# Altium schematic sheet Sheet1.SchDoc
size 410 x 297 mm; SheetNumber: 2; SheetTotal: 2
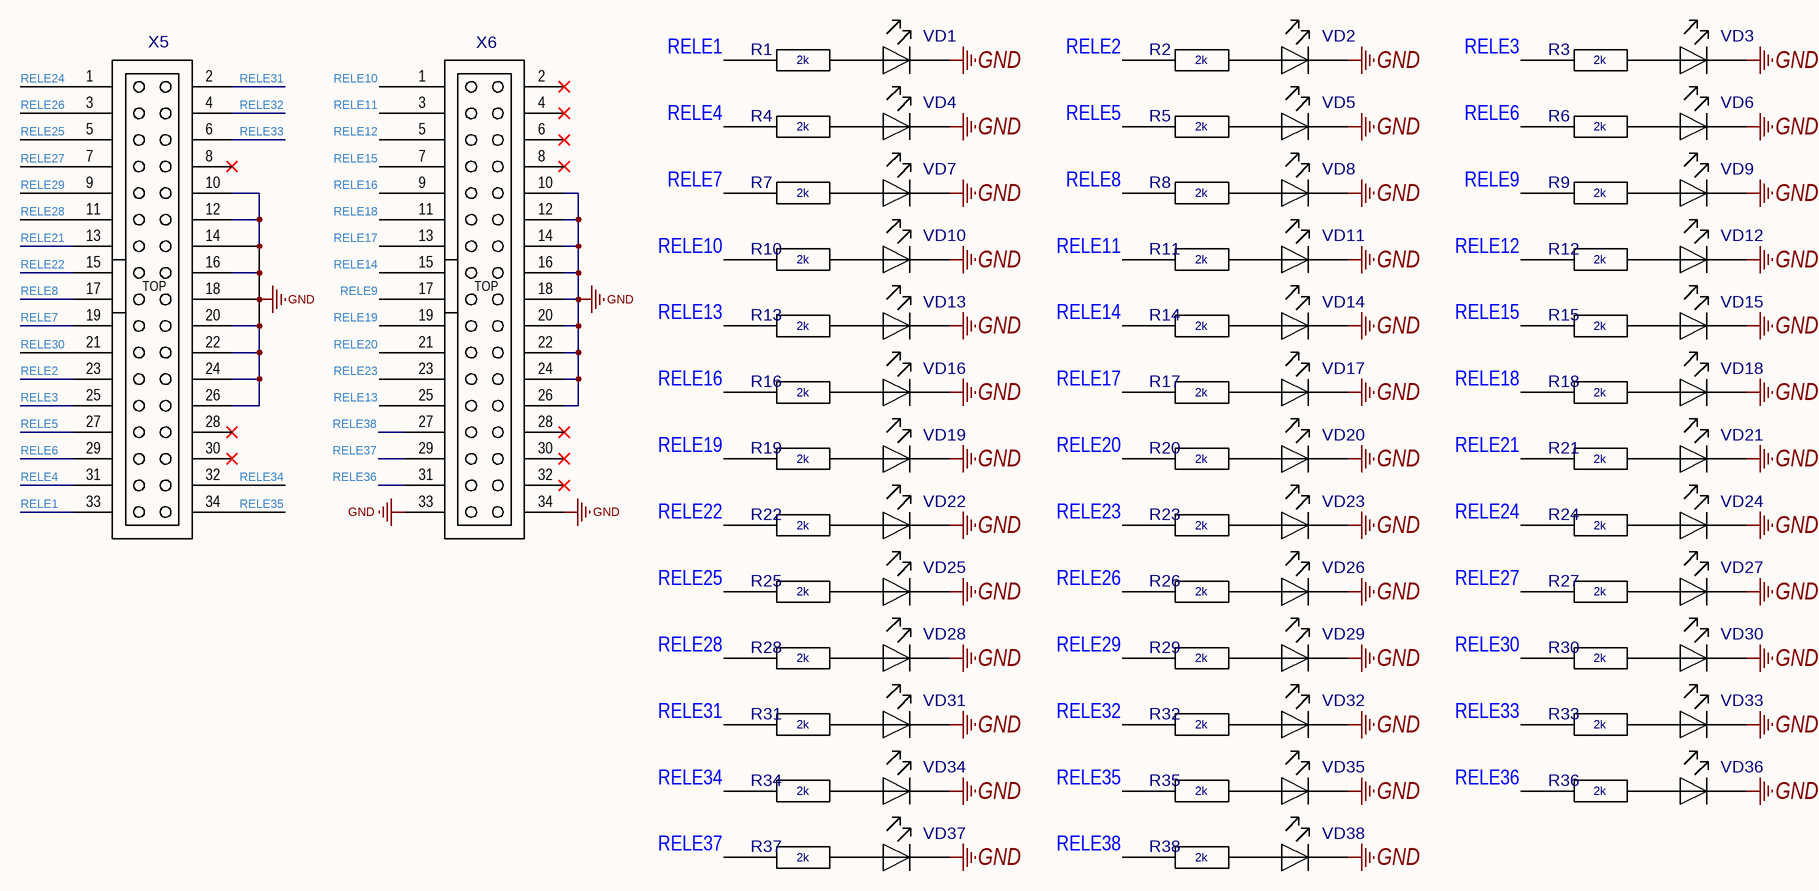
[diagram p0: Sheet1.SchDoc]

## Parts
R1  2k  [0805]
R2  2k  [0805]
R3  2k  [0805]
R4  2k  [0805]
R5  2k  [0805]
R6  2k  [0805]
R7  2k  [0805]
R8  2k  [0805]
R9  2k  [0805]
R10  2k  [0805]
R11  2k  [0805]
R12  2k  [0805]
R13  2k  [0805]
R14  2k  [0805]
R15  2k  [0805]
R16  2k  [0805]
R17  2k  [0805]
R18  2k  [0805]
R19  2k  [0805]
R20  2k  [0805]
R21  2k  [0805]
R22  2k  [0805]
R23  2k  [0805]
R24  2k  [0805]
R25  2k  [0805]
R26  2k  [0805]
R27  2k  [0805]
R28  2k  [0805]
R29  2k  [0805]
R30  2k  [0805]
R31  2k  [0805]
R32  2k  [0805]
R33  2k  [0805]
R34  2k  [0805]
R35  2k  [0805]
R36  2k  [0805]
R37  2k  [0805]
R38  2k  [0805]
VD1  LED(0805)  [0805(LED)]  (value not drawn)
VD2  LED(0805)  [0805(LED)]  (value not drawn)
VD3  LED(0805)  [0805(LED)]  (value not drawn)
VD4  LED(0805)  [0805(LED)]  (value not drawn)
VD5  LED(0805)  [0805(LED)]  (value not drawn)
VD6  LED(0805)  [0805(LED)]  (value not drawn)
VD7  LED(0805)  [0805(LED)]  (value not drawn)
VD8  LED(0805)  [0805(LED)]  (value not drawn)
VD9  LED(0805)  [0805(LED)]  (value not drawn)
VD10  LED(0805)  [0805(LED)]  (value not drawn)
VD11  LED(0805)  [0805(LED)]  (value not drawn)
VD12  LED(0805)  [0805(LED)]  (value not drawn)
VD13  LED(0805)  [0805(LED)]  (value not drawn)
VD14  LED(0805)  [0805(LED)]  (value not drawn)
VD15  LED(0805)  [0805(LED)]  (value not drawn)
VD16  LED(0805)  [0805(LED)]  (value not drawn)
VD17  LED(0805)  [0805(LED)]  (value not drawn)
VD18  LED(0805)  [0805(LED)]  (value not drawn)
VD19  LED(0805)  [0805(LED)]  (value not drawn)
VD20  LED(0805)  [0805(LED)]  (value not drawn)
VD21  LED(0805)  [0805(LED)]  (value not drawn)
VD22  LED(0805)  [0805(LED)]  (value not drawn)
VD23  LED(0805)  [0805(LED)]  (value not drawn)
VD24  LED(0805)  [0805(LED)]  (value not drawn)
VD25  LED(0805)  [0805(LED)]  (value not drawn)
VD26  LED(0805)  [0805(LED)]  (value not drawn)
VD27  LED(0805)  [0805(LED)]  (value not drawn)
VD28  LED(0805)  [0805(LED)]  (value not drawn)
VD29  LED(0805)  [0805(LED)]  (value not drawn)
VD30  LED(0805)  [0805(LED)]  (value not drawn)
VD31  LED(0805)  [0805(LED)]  (value not drawn)
VD32  LED(0805)  [0805(LED)]  (value not drawn)
VD33  LED(0805)  [0805(LED)]  (value not drawn)
VD34  LED(0805)  [0805(LED)]  (value not drawn)
VD35  LED(0805)  [0805(LED)]  (value not drawn)
VD36  LED(0805)  [0805(LED)]  (value not drawn)
VD37  LED(0805)  [0805(LED)]  (value not drawn)
VD38  LED(0805)  [0805(LED)]  (value not drawn)
X5  (no value)  [BH-34(DS1013-34S)]
X6  (no value)  [BH-34(DS1013-34S)]

## Nets
GND: VD1.2(K) VD2.2(K) VD3.2(K) VD4.2(K) VD5.2(K) VD6.2(K) VD7.2(K) VD8.2(K) VD9.2(K) VD10.2(K) VD11.2(K) VD12.2(K) VD13.2(K) VD14.2(K) VD15.2(K) VD16.2(K) VD17.2(K) VD18.2(K) VD19.2(K) VD20.2(K) VD21.2(K) VD22.2(K) VD23.2(K) VD24.2(K) VD25.2(K) VD26.2(K) VD27.2(K) VD28.2(K) VD29.2(K) VD30.2(K) VD31.2(K) VD32.2(K) VD33.2(K) VD34.2(K) VD35.2(K) VD36.2(K) VD37.2(K) VD38.2(K) X5.10 X5.12 X5.14 X5.16 X5.18 X5.20 X5.22 X5.24 X5.26 X6.10 X6.12 X6.14 X6.16 X6.18 X6.20 X6.22 X6.24 X6.26 X6.33 X6.34
RELE1: R1.1 X5.33
RELE2: R2.1 X5.23
RELE3: R3.1 X5.25
RELE4: R4.1 X5.31
RELE5: R5.1 X5.27
RELE6: R6.1 X5.29
RELE7: R7.1 X5.19
RELE8: R8.1 X5.17
RELE9: R9.1 X6.17
RELE10: R10.1 X6.1
RELE11: R11.1 X6.3
RELE12: R12.1 X6.5
RELE13: R13.1 X6.25
RELE14: R14.1 X6.15
RELE15: R15.1 X6.7
RELE16: R16.1 X6.9
RELE17: R17.1 X6.13
RELE18: R18.1 X6.11
RELE19: R19.1 X6.19
RELE20: R20.1 X6.21
RELE21: R21.1 X5.13
RELE22: R22.1 X5.15
RELE23: R23.1 X6.23
RELE24: R24.1 X5.1
RELE25: R25.1 X5.5
RELE26: R26.1 X5.3
RELE27: R27.1 X5.7
RELE28: R28.1 X5.11
RELE29: R29.1 X5.9
RELE30: R30.1 X5.21
RELE31: R31.1 X5.2
RELE32: R32.1 X5.4
RELE33: R33.1 X5.6
RELE34: R34.1 X5.32
RELE35: R35.1 X5.34
RELE36: R36.1 X6.31
RELE37: R37.1 X6.29
RELE38: R38.1 X6.27
NetR1_2: R1.2 VD1.1(A)
NetR2_2: R2.2 VD2.1(A)
NetR3_2: R3.2 VD3.1(A)
NetR4_2: R4.2 VD4.1(A)
NetR5_2: R5.2 VD5.1(A)
NetR6_2: R6.2 VD6.1(A)
NetR7_2: R7.2 VD7.1(A)
NetR8_2: R8.2 VD8.1(A)
NetR9_2: R9.2 VD9.1(A)
NetR10_2: R10.2 VD10.1(A)
NetR11_2: R11.2 VD11.1(A)
NetR12_2: R12.2 VD12.1(A)
NetR13_2: R13.2 VD13.1(A)
NetR14_2: R14.2 VD14.1(A)
NetR15_2: R15.2 VD15.1(A)
NetR16_2: R16.2 VD16.1(A)
NetR17_2: R17.2 VD17.1(A)
NetR18_2: R18.2 VD18.1(A)
NetR19_2: R19.2 VD19.1(A)
NetR20_2: R20.2 VD20.1(A)
NetR21_2: R21.2 VD21.1(A)
NetR22_2: R22.2 VD22.1(A)
NetR23_2: R23.2 VD23.1(A)
NetR24_2: R24.2 VD24.1(A)
NetR25_2: R25.2 VD25.1(A)
NetR26_2: R26.2 VD26.1(A)
NetR27_2: R27.2 VD27.1(A)
NetR28_2: R28.2 VD28.1(A)
NetR29_2: R29.2 VD29.1(A)
NetR30_2: R30.2 VD30.1(A)
NetR31_2: R31.2 VD31.1(A)
NetR32_2: R32.2 VD32.1(A)
NetR33_2: R33.2 VD33.1(A)
NetR34_2: R34.2 VD34.1(A)
NetR35_2: R35.2 VD35.1(A)
NetR36_2: R36.2 VD36.1(A)
NetR37_2: R37.2 VD37.1(A)
NetR38_2: R38.2 VD38.1(A)

Not connected (* = marked no-connect by the designer): X5 8* 28* 30*; X6 2* 4* 6* 8* 28* 30* 32*

## Notes on the sheet
- Перв. примен.
- Справ. №
- Подп. и дата
- Инв. № дубл.
- Взам. инв. №
- Разраб.
- Изм.
- Лист
- № докум.
- Подп.
- Дата
- Литера
- Масса
- Масштаб
- Пров.
- Т.контр.
- Листов
- Инв. № подл.
- Н.контр.
- Утв.
- Форма 1 ГОСТ 2.104-2006
- Копировал
- Формат А3
- (in symbol BH-34(DS1013-34S)) TOP

## Library data of the parts
R1-R38 = R0805 Yageo: ComponentHeigt: 0.6; Firme: Yageo; Leadform: SMD; Kind: Резистор; ClassName: *; ComponentWeigt: *; Component Link: *; Packaging: 0805; NN: *; Value: *
VD1-VD38 = LED(0805): ComponentHeigt: 0.75; Leadform: в отверстия; Firme: Kingbright; NN: 24003000; KIND: Светодиод L-1154GD Kingbright; Component Link: *; ClassName: *
X5 X6 = BH-34(DS1013-34S): ComponentHeigt: 5.5; Name: Вилка; Specification: Вилка PLD2-2 *; Typ: PLD2-2; ClassName: *; Component Link: *; ComponentWeigt: *; Firme: *; Leadform: *; NN: *; KIND: *